# EasyEDA Pro project DZZH_carrier.epro

# Schematic DZZH_carrier
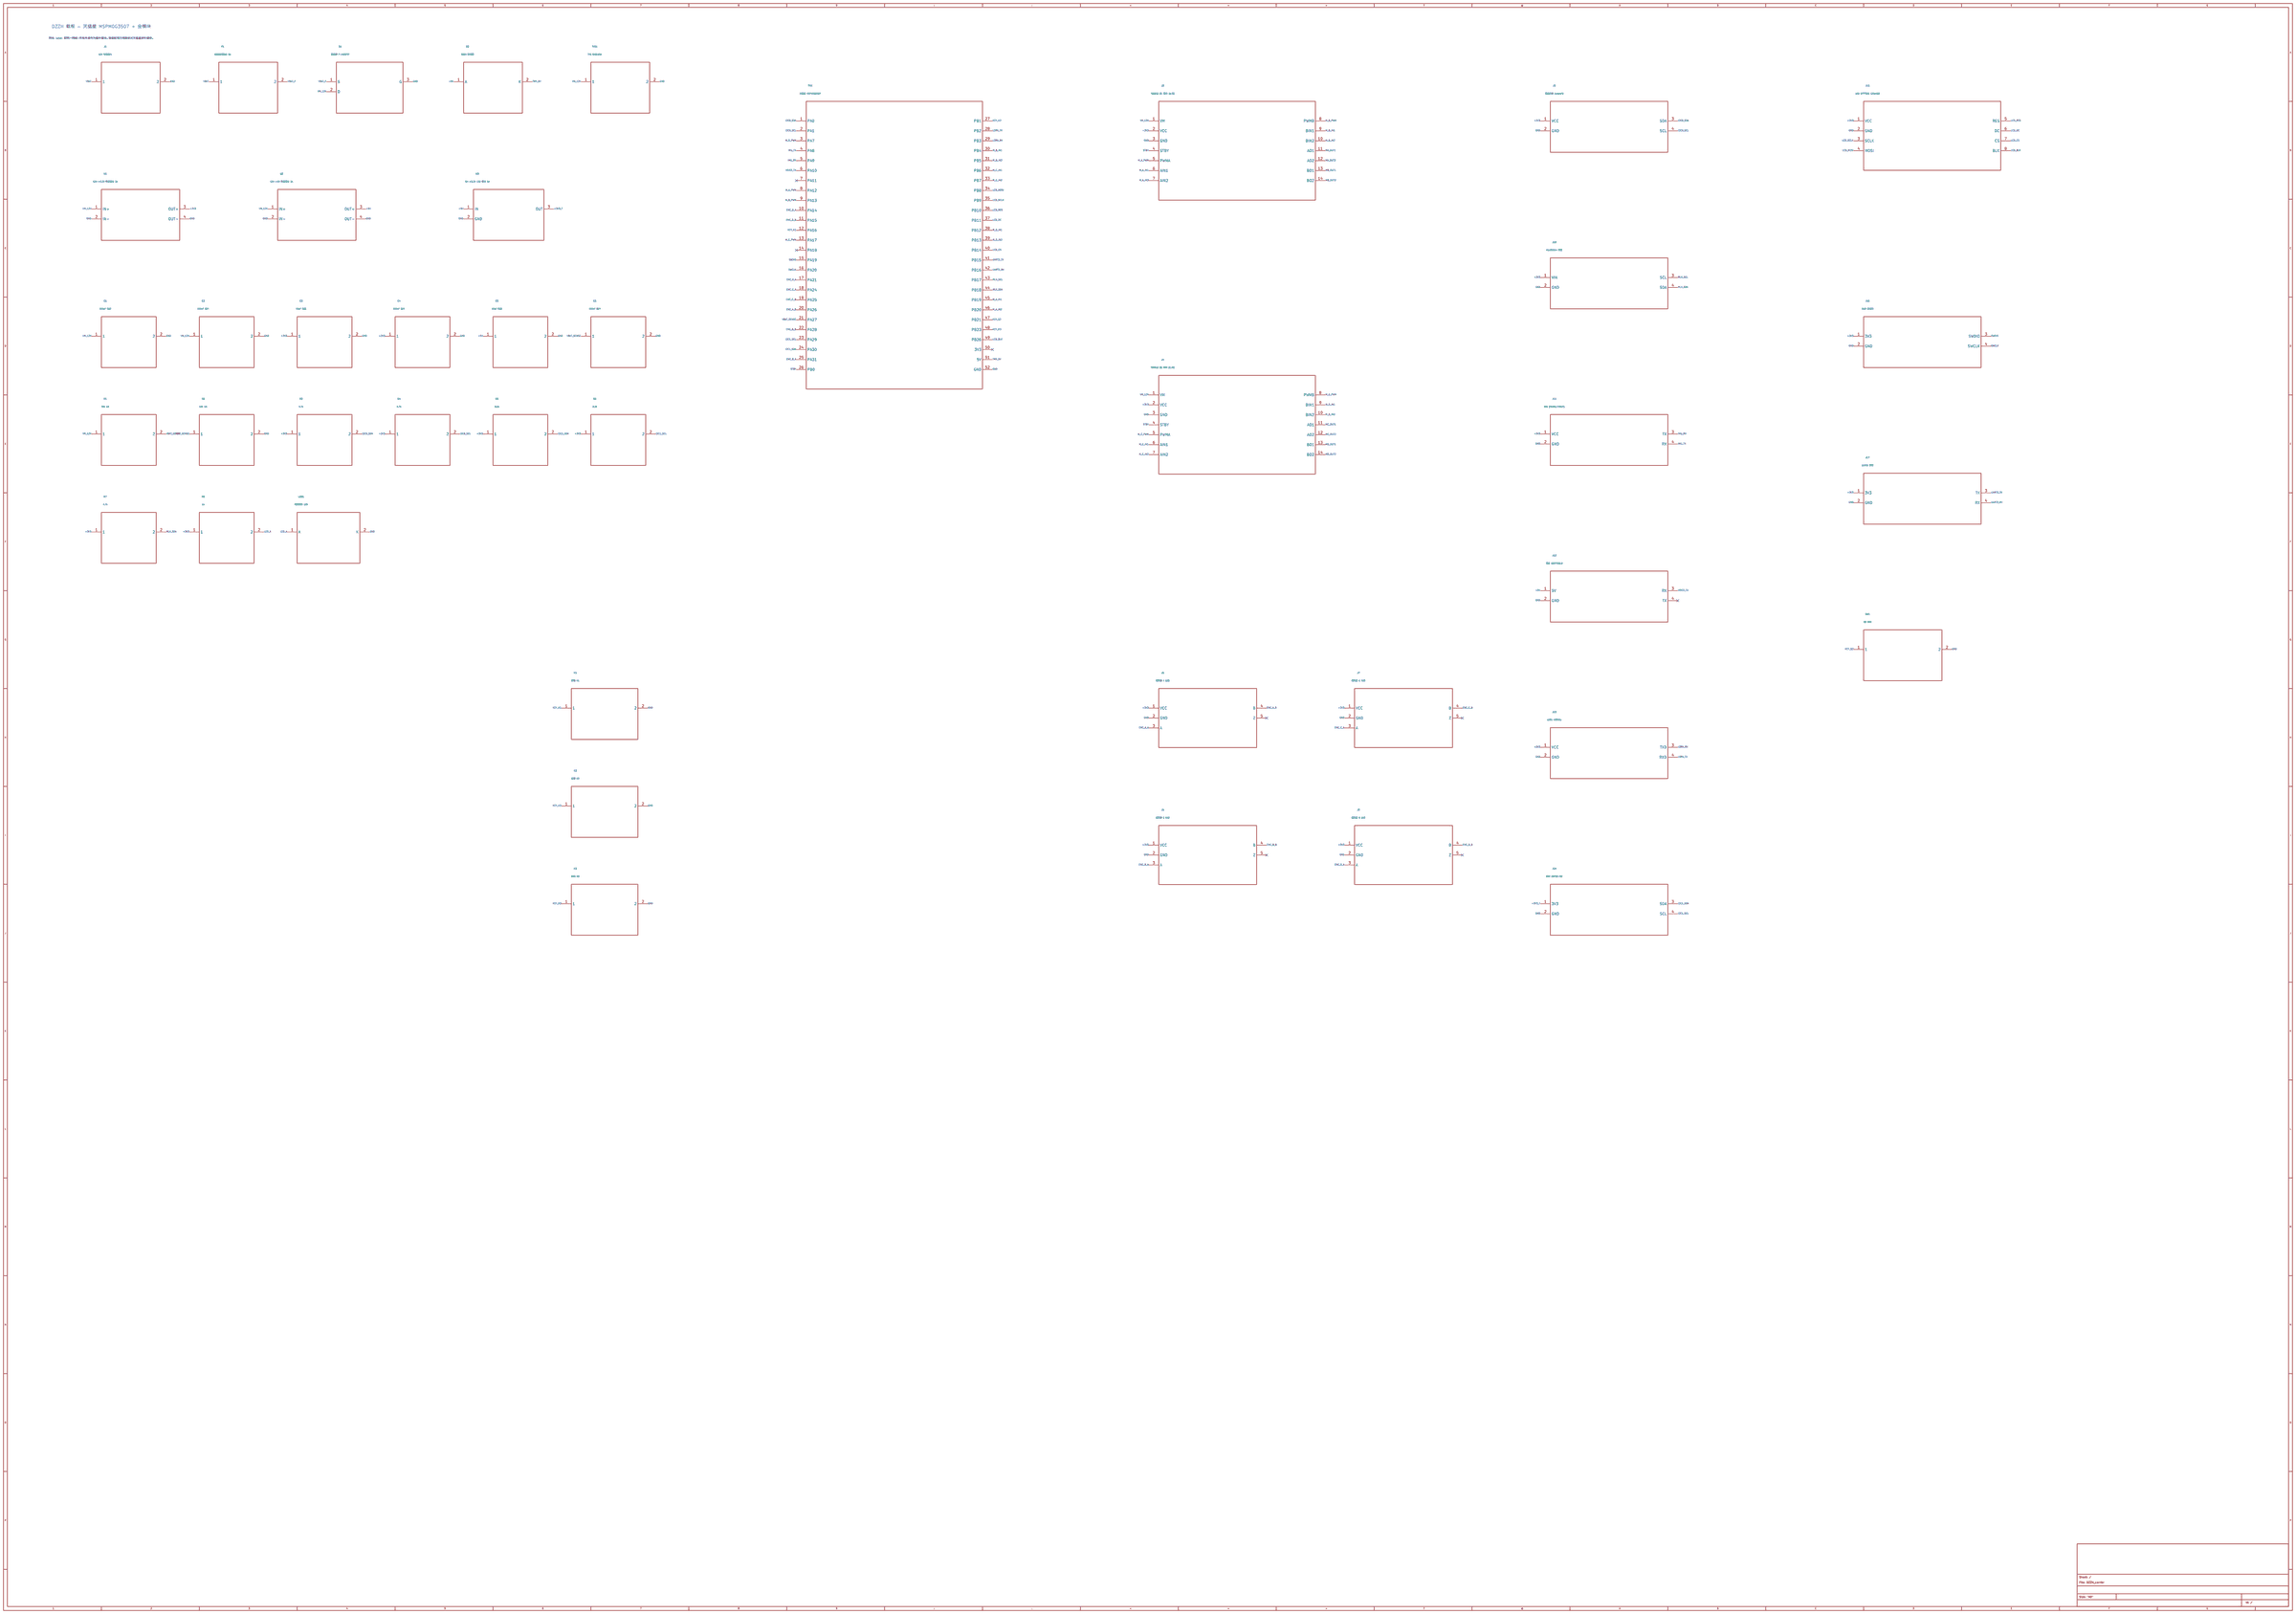
[diagram p0: schematic sheet]

## Parts
C1  100uF 电解  [CAP-6.3x7.7]
C2  100nF 瓷片  [C0603]
C3  10uF 陶瓷  [C0805]
C4  100nF 瓷片  [C0603]
C5  10uF 陶瓷  [C0805]
C6  100nF 瓷片  [C0603]
D1  防反接 P-MOSFET  [SOT-23]
D2  SS34 防倒灌  [SMA]
F1  自恢复保险丝 5A  [Fuse1206]
J1  12V 电池输入  [KF301-2P]
J3  TB6612 #1 模块 (A/B)  [HDR-2X7]
J4  TB6612 #2 模块 (C/D)  [HDR-2X7]
J5  编码器 A 左前  [HDR-1X5]
J6  编码器 B 右前  [HDR-1X5]
J7  编码器 C 右后  [HDR-1X5]
J8  编码器 D 左后  [HDR-1X5]
J9  循迹灰度 AuroraT8  [HDR-1X4]
J10  MLX90614 测温  [HDR-1X4]
J11  IMU (YbIMU/JY61P)  [HDR-1X4]
J12  语音 ASRPRO2.0  [HDR-1X4]
J13  LORA 433MHz  [HDR-1X4]
J14  授时 ESP32-S2  [HDR-1X4]
J15  LCD ST7735S 128x160  [HDR-1X8]
J16  SWD 调试口  [HDR-1X4]
J17  UART2 预留  [HDR-1X4]
K1  按键 K1  [SW-TH_6x6]
K2  按键 K2  [SW-TH_6x6]
K3  按键 K3  [SW-TH_6x6]
LED1  电源指示 LED  [LED0603]
R1  30k 1%  [R0603]
R2  10k 1%  [R0603]
R3  4.7k  [R0603]
R4  4.7k  [R0603]
R5  2.2k  [R0603]
R6  2.2k  [R0603]
R7  4.7k  [R0603]
R8  1k  [R0603]
SW1  S2 按键  [SW-TH_6x6]
TMX  天猛星 MSPM0G3507  [TMX]
TVS1  TVS SMBJ15A  [SMA]
U1  12V->3.3V 降压模块 3A  [HDR-1X4]
U2  12V->5V 降压模块 2A  [HDR-1X4]
U3  5V->3.3V LDO 模块 1A  [HDR-1X3]

## Library data of the parts
C1 = C1
C2 = C2
C3 = C3
C4 = C4
C5 = C5
C6 = C6
D1 = D1
D2 = D2
F1 = F1
J1 = J1
J3 = J3
J4 = J4
J5 = J5
J6 = J6
J7 = J7
J8 = J8
J9 = J9
J10 = J10
J11 = J11
J12 = J12
J13 = J13
J14 = J14
J15 = J15
J16 = J16
J17 = J17
K1 = K1
K2 = K2
K3 = K3
LED1 = LED1
R1 = R1
R2 = R2
R3 = R3
R4 = R4
R5 = R5
R6 = R6
R7 = R7
R8 = R8
SW1 = SW1
TMX = TMX
TVS1 = TVS1
U1 = U1
U2 = U2
U3 = U3

## Nets
+3V3: C3.1 C4.1 J3.2(VCC) J4.2(VCC) J5.1(VCC) J6.1(VCC) J7.1(VCC) J8.1(VCC) J9.1(VCC) J10.1(VIN) J11.1(VCC) J13.1(VCC) J15.1(VCC) J16.1(3V3) J17.1(3V3) R3.1 R4.1 R5.1 R6.1 R7.1 R8.1 U1.3(OUT+)
+3V3_T: J14.1(3V3) U3.3(OUT)
+5V: C5.1 D2.1(A) J12.1(5V) U2.3(OUT+) U3.1(IN)
GND: C1.2 C2.2 C3.2 C4.2 C5.2 C6.2 D1.3(G) J1.2 J3.3(GND) J4.3(GND) J5.2(GND) J6.2(GND) J7.2(GND) J8.2(GND) J9.2(GND) J10.2(GND) J11.2(GND) J12.2(GND) J13.2(GND) J14.2(GND) J15.2(GND) J16.2(GND) J17.2(GND) K1.2 K2.2 K3.2 LED1.2(K) R2.2 SW1.2 TMX.52(GND) TVS1.2 U1.2(IN-) U1.4(OUT-) U2.2(IN-) U2.4(OUT-) U3.2(GND)
VBAT: F1.1 J1.1
VBAT_F: D1.1(S) F1.2
VBAT_SENSE: C6.1 R1.2 R2.1 TMX.21(PA27)
ENC_A_A: J5.3(A) TMX.17(PA21)
ENC_A_B: J5.4(B) TMX.20(PA26)
ENC_B_A: J6.3(A) TMX.25(PA31)
ENC_B_B: J6.4(B) TMX.22(PA28)
ENC_C_A: J7.3(A) TMX.18(PA24)
ENC_C_B: J7.4(B) TMX.19(PA25)
ENC_D_A: J8.3(A) TMX.10(PA14)
ENC_D_B: J8.4(B) TMX.11(PA15)
I2C0_SCL: J9.4(SCL) R4.2 TMX.2(PA1)
I2C0_SDA: J9.3(SDA) R3.2 TMX.1(PA0)
I2C1_SCL: J14.4(SCL) R6.2 TMX.23(PA29)
I2C1_SDA: J14.3(SDA) R5.2 TMX.24(PA30)
IMU_RX: J11.3(TX) TMX.5(PA9)
IMU_TX: J11.4(RX) TMX.4(PA8)
KEY_K1: K1.1 TMX.12(PA16)
KEY_K2: K2.1 TMX.27(PB1)
KEY_K3: K3.1 TMX.48(PB23)
KEY_S2: SW1.1 TMX.47(PB21)
LCD_BLK: J15.8(BLK) TMX.49(PB26)
LCD_CS: J15.7(CS) TMX.40(PB14)
LCD_DC: J15.6(DC) TMX.37(PB11)
LCD_MOSI: J15.4(MOSI) TMX.34(PB8)
LCD_RES: J15.5(RES) TMX.36(PB10)
LCD_SCLK: J15.3(SCLK) TMX.35(PB9)
LED_A: LED1.1(A) R8.2
LORA_RX: J13.3(TXD) TMX.29(PB3)
LORA_TX: J13.4(RXD) TMX.28(PB2)
M_A_IN1: J3.6(AIN1) TMX.45(PB19)
M_A_IN2: J3.7(AIN2) TMX.46(PB20)
M_A_PWM: J3.5(PWMA) TMX.8(PA12)
M_B_IN1: J3.9(BIN1) TMX.30(PB4)
M_B_IN2: J3.10(BIN2) TMX.31(PB5)
M_B_PWM: J3.8(PWMB) TMX.9(PA13)
M_C_IN1: J4.6(AIN1) TMX.32(PB6)
M_C_IN2: J4.7(AIN2) TMX.33(PB7)
M_C_PWM: J4.5(PWMA) TMX.13(PA17)
M_D_IN1: J4.9(BIN1) TMX.38(PB12)
M_D_IN2: J4.10(BIN2) TMX.39(PB13)
M_D_PWM: J4.8(PWMB) TMX.3(PA7)
MA_OUT1: J3.11(AO1)
MA_OUT2: J3.12(AO2)
MB_OUT1: J3.13(BO1)
MB_OUT2: J3.14(BO2)
MC_OUT1: J4.11(AO1)
MC_OUT2: J4.12(AO2)
MD_OUT1: J4.13(BO1)
MD_OUT2: J4.14(BO2)
MLX_SCL: J10.3(SCL) TMX.43(PB17)
MLX_SDA: J10.4(SDA) R7.2 TMX.44(PB18)
STBY: J3.4(STBY) J4.4(STBY) TMX.26(PB0)
SWCLK: J16.4(SWCLK) TMX.16(PA20)
SWDIO: J16.3(SWDIO) TMX.15(PA19)
TMX_5V: D2.2(K) TMX.51(5V)
UART2_RX: J17.4(RX) TMX.42(PB16)
UART2_TX: J17.3(TX) TMX.41(PB15)
VM_12V: C1.1 C2.1 D1.2(D) J3.1(VM) J4.1(VM) R1.1 TVS1.1 U1.1(IN+) U2.1(IN+)
VOICE_TX: J12.3(RX) TMX.6(PA10)

Not connected (* = marked no-connect by the designer): J5 5(Z)*; J6 5(Z)*; J7 5(Z)*; J8 5(Z)*; J12 4(TX)*; TMX 7(PA11)* 14(PA18)* 50(3V3)*

## Notes on the sheet
- DZZH 载板 — 天猛星 MSPM0G3507 + 全模块
- 同名 label 即同一网络；所有外设均为插件模块。落板前用万用表核对天猛星排针顺序。
